# Altium schematic sheet LC振荡器.SchDoc
size A4
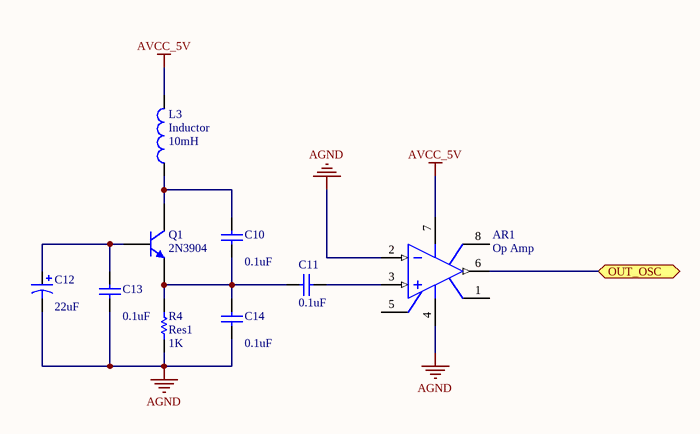
[diagram p0: LC振荡器.SchDoc]

## Parts
AR1  Op Amp  [DIP8]
C10  value 0.1uF  [CB1]  (hidden comment: Cap)
C11  value 0.1uF  [CB1]  (hidden comment: Cap)
C12  value 22uF  [CD6]  (hidden comment: Cap Pol1)
C13  value 0.1uF  [CB1]  (hidden comment: Cap)
C14  value 0.1uF  [CB1]  (hidden comment: Cap)
L3  Inductor  value 10mH  [2PIN]
Q1  2N3904  [TO-92A]
R4  Res1  value 1K  [AXIAL-0.3]

## Ports
OUT_OSC

## Nets
AGND: AR1.2(IN-) AR1.4(V-) C12.2 C13.1 C14.1 R4.1
AVCC_5V: AR1.7(V+) L3.2
OUT_OSC: AR1.6(OUT) ; port OUT_OSC
NetAR1_3: AR1.3(IN+) C11.1
NetC10_1: C10.1 C11.2 C14.2 Q1.1(E) R4.2
NetC10_2: C10.2 L3.1 Q1.3(C)
NetC12_1: C12.1 C13.2 Q1.2(B)

Not connected (* = marked no-connect by the designer): AR1 1(OS_NUL) 5(OS_NUL) 8(TAB)

## Library data of the parts
AR1 = Op Amp: FET Operational Amplifier; Published: 8-Jun-2000; LatestRevisionDate: 17-Jul-2002; LatestRevisionNote: Re-released for DXP Platform.; DatasheetVersion: REV. B; PackageVersion: 1990; PackageReference: H-08A; Publisher: Altium Limited; PackageDescription: Can; 8 Leads; Pin Circle Dia. 5.08 mm; Lead Dia. 0.53 mm (max); ComponentLink1Description: Manufacturer Link; ComponentLink1URL: http://www.analog.com/
C10 C11 C13 C14 = Cap: Capacitor; Published: 8-Jun-2000; LatestRevisionDate: 17-Jul-2002; LatestRevisionNote: Re-released for DXP Platform.; PackageReference: RAD-0.3; Publisher: Altium Limited; PackageDescription: Radial Cap, Thru-Hole; 2 Leads; 0.3 in Pin Spacing
C12 = Cap Pol1: Polarized Capacitor (Radial); Published: 8-Jun-2000; LatestRevisionDate: 17-Jul-2002; LatestRevisionNote: Re-released for DXP Platform.; PackageReference: RB7.6-15; Publisher: Altium Limited; PackageDescription: Polarized Capacitor (Radial); 2 Leads
L3 = Inductor: Code_IEC: 1005; Published: 8-Jun-2000; LatestRevisionDate: 29-May-2009; LatestRevisionNote: IPC-7351 Footprint Added.; PackageReference: 0402-A; Publisher: Altium Limited; PackageDescription: Chip Inductor; Code_JEITA: 0402
Q1 = 2N3904: NPN General Purpose Amplifier; Published: 8-Jun-2000; LatestRevisionDate: 15-Jan-2003; LatestRevisionNote: PCB Footprint 'BCY-W3/D4.7' replaced; DatasheetVersion: 1997; PackageVersion: Sep-1998; PackageReference: TO-92A; Publisher: Altium Limited; PackageDescription: TO, Flat Index; 3 In-Line, Axial Leads; Body Dia. 4.5mm; Leads 0.51 x 0.48 mm (max); ComponentLink1Description: Manufacturer Link; ComponentLink1URL: http://www.fairchildsemi.com/; ComponentLink2Description: Datasheet; ComponentLink2URL: http://www.fairchildsemi.com/ds/2N%2F2N3904.pdf
R4 = Res1: Resistor; Published: 8-Jun-2000; LatestRevisionDate: 17-Jul-2002; LatestRevisionNote: Re-released for DXP Platform.; PackageReference: AXIAL-0.3; Publisher: Altium Limited; PackageDescription: Axial Device, Thru-Hole; 2 Leads; 0.3 in Pin Spacing